# Altium schematic sheet A2x3_next.SchDoc
size 1261 x 594 mm; DocumentNumber: Введите номер платы + Э3; SheetNumber: номер страницы; Format: A2x3
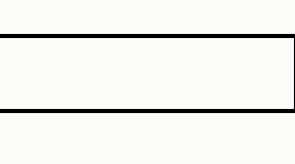
[diagram p0: A2x3_next.SchDoc, top column 1 of 4]
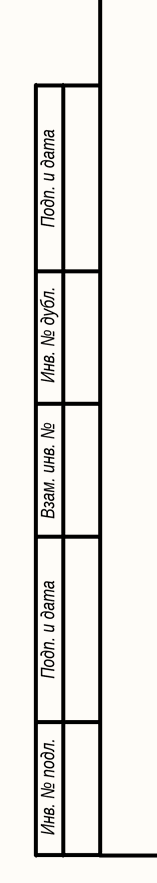
[diagram p1: A2x3_next.SchDoc, bottom column 1 of 4]
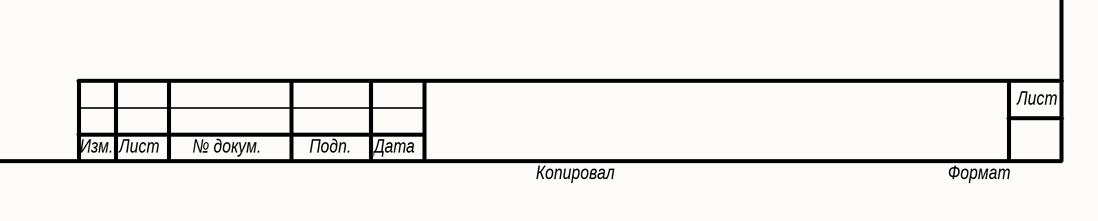
[diagram p2: A2x3_next.SchDoc, bottom column 4 of 4]

## Notes on the sheet
- Подп. и дата
- Инв. № дубл.
- Взам. инв. №
- Инв. № подл.
- Лист
- Изм.
- № докум.
- Подп.
- Дата
- Копировал
- Формат